# EasyEDA Pro project MiniPID_Manual.epro, board PCB1
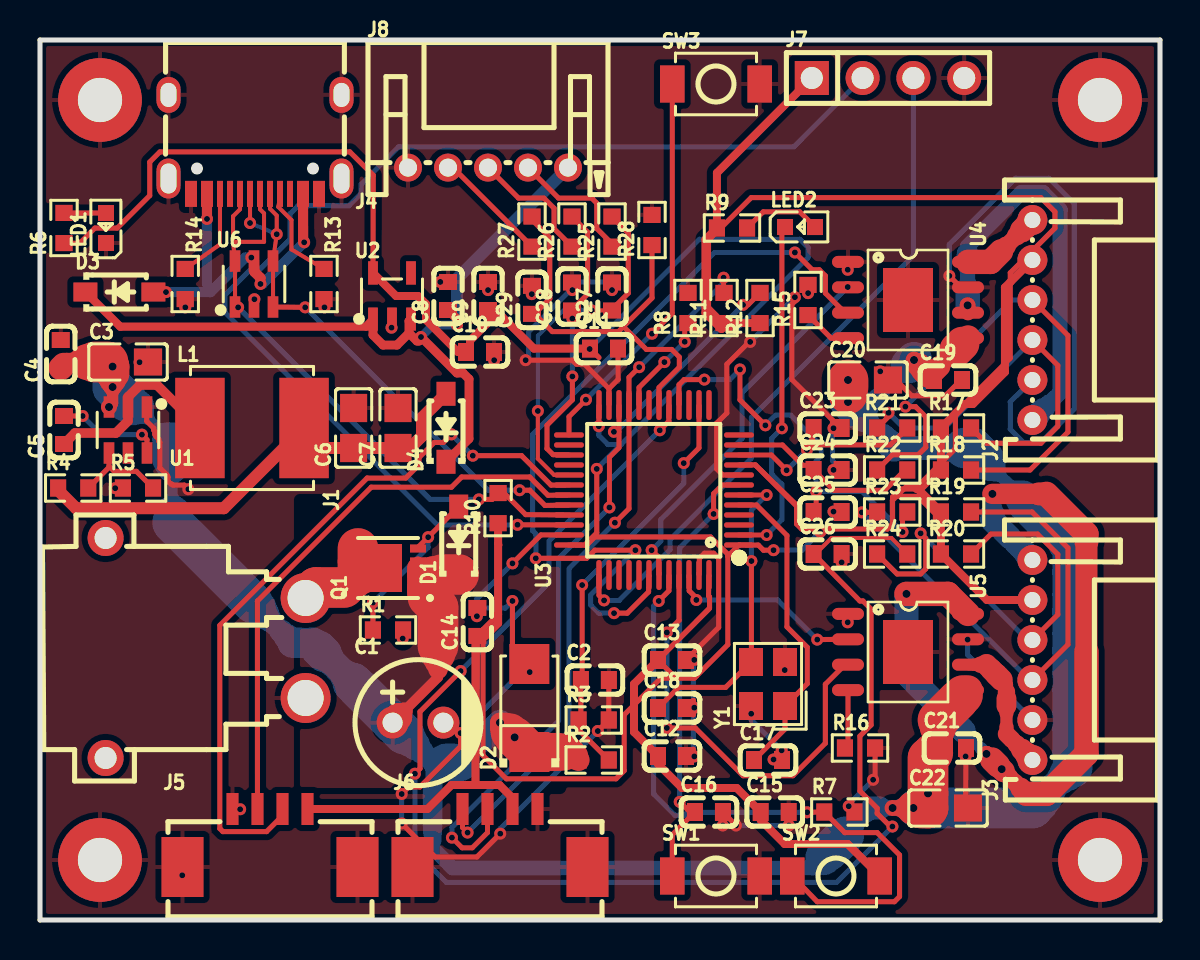
[diagram p1: board, top side]
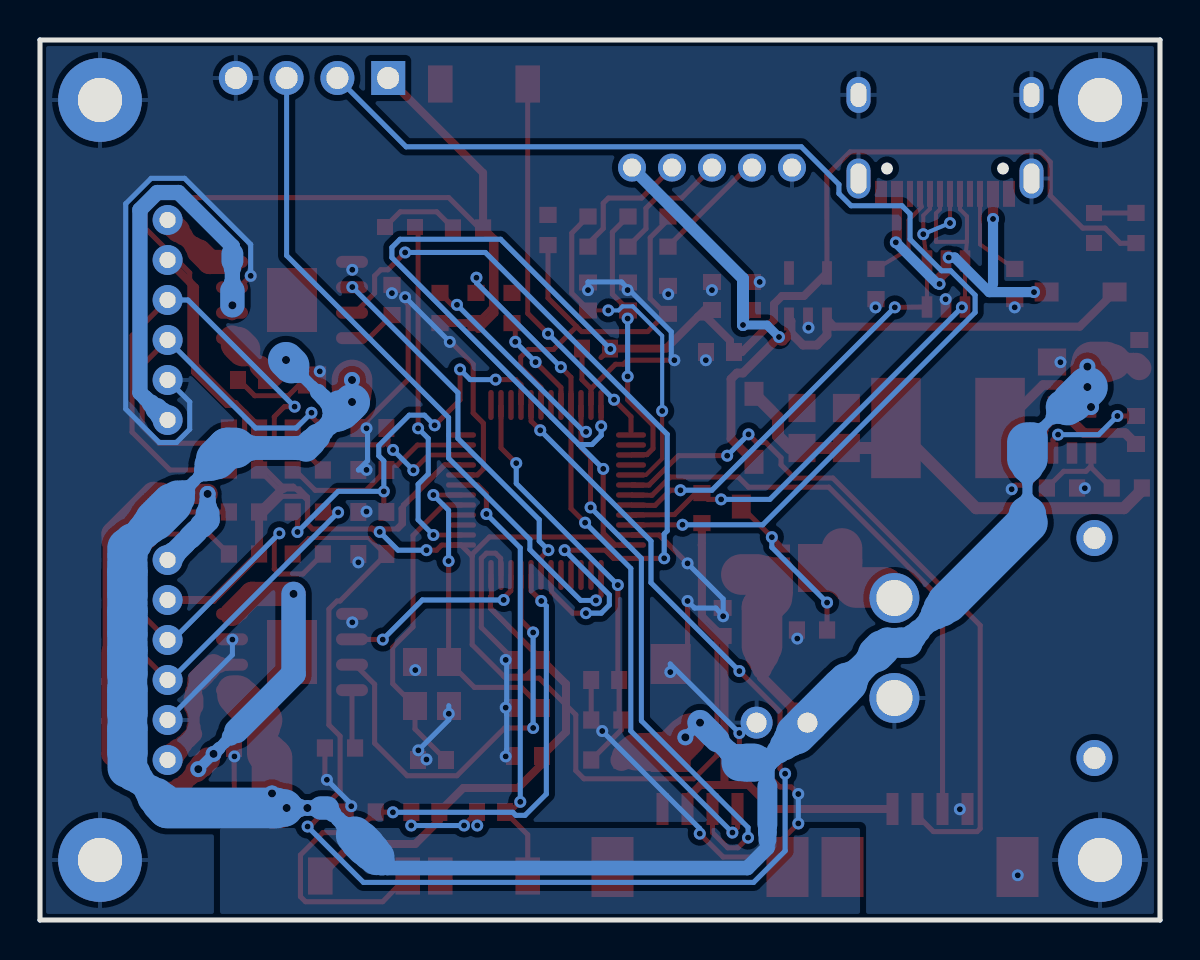
[diagram p2: board, bottom side, seen from below]

Outline 56 x 44 mm; copper layers: Top Layer, Bottom Layer. Coordinates in mm from the lower left corner of the outline.
Outline path: 0,44 56,44 56,0 0,0 0,44
Stack: Top Layer 0.035mm / Dielectric1 1.51mm FR4 er 4.5 / Bottom Layer 0.035mm

## Design rules (mm)
spacing copperThickness1oz (default): track to track 0.2, other pairs 0.15 to 0.3
spacing copperThickness2oz: track to track 0.203, other pairs 0.152 to 0.3
spacing USB_CL: track to track 0.15, other pairs 0.15 to 0.3
track width copperThickness1oz (default): min 0.203, default 0.254, max 2.54
track width copperThickness2oz: min 0.203, default 0.254, max 2.54
track width PWR_HI: min 0.5, default 1, max 5
track width PWR_5V: min 0.3, default 0.6, max 5
track width PWR_3V3: min 0.254, default 0.4, max 5
track width GND_TRK: min 0.254, default 0.5, max 5
differential pair differentialPair (default): width min 0.127, default 0.254, max 2.54; gap min 0.152, default 0.152
net VIN uses PWR_HI, PWR_VIA
net GND uses GND_TRK
net +5V_BUCK uses PWR_5V
net +5V uses PWR_5V
net +3V3 uses PWR_3V3
net VBUS uses PWR_5V, USB_CL
net VIN_RAW uses PWR_HI, PWR_VIA
net M1_OUT1 uses PWR_HI, PWR_VIA
net M1_OUT2 uses PWR_HI, PWR_VIA
net M2_OUT1 uses PWR_HI, PWR_VIA
net M2_OUT2 uses PWR_HI, PWR_VIA
net USB_CC1 uses USB_CL
net USB_DM uses USB_CL
net USB_DP uses USB_CL
net USB_CC2 uses USB_CL
net BUCK_SW uses PWR_5V

## Placement (name value [footprint] x y rotation side)
C1  100uF  [CAP-TH_BD6.3-P2.50-D1.0-FD]  18.9 9.87 0 top
C2  100nF  [C0603]  27.74 12 0 top
C3  10uF  [C0805]  4.4 27.9 0 top
C4  100nF  [C0603]  1.04 28.3 90 top
C5  100nF  [C0603]  1.2 24.5 90 top
C6  22uF  [C0805]  15.68 24.6 90 top
C7  22uF  [C0805]  17.9 24.6 90 top
C8  1uF  [C0603]  20.4 31.2 90 top
C9  4.7uF  [C0603]  22.4 31.2 90 top
C10  100nF  [C0603]  22 28.4 0 top
C11  100nF  [C0603]  28.2 28.57 0 top
C12  100nF  [C0603]  31.6 8.2 0 top
C13  4.7uF  [C0603]  31.6 13 0 top
C14  100nF  [C0603]  21.87 14.9 90 top
C15  1uF  [C0603]  36.74 5.4 0 top
C16  100nF  [C0603]  33.45 5.4 0 top
C17  20pF  [C0603]  36.4 8 0 top
C18  20pF  [C0603]  31.6 10.6 0 top
C19  100nF  [C0603]  45.4 27 0 top
C20  10uF  [C0805]  41.4 27 0 top
C21  100nF  [C0603]  45.6 8.6 0 top
C22  10uF  [C0805]  45.4 5.6 0 top
C23  1nF  [C0603]  39.38 24.6 0 top
C24  1nF  [C0603]  39.38 22.5 0 top
C25  1nF  [C0603]  39.38 20.4 0 top
C26  1nF  [C0603]  39.38 18.3 0 top
C27  1nF  [C0603]  28.6 31.18 90 top
C28  1nF  [C0603]  26.6 31.18 90 top
C29  1nF  [C0603]  24.6 31.01 90 top
D1  BZT52C10  [SOD-123_L2.7-W1.6-LS3.7-RD-1]  20.94 18.97 90 top
D2  SMAJ18A  [SMA_L4.3-W2.6-LS5.2-RD]  24.47 10.6 90 top
D3  B5819W SL  [SOD-123_L2.7-W1.6-LS3.7-RD-1]  3.97 31.4 0 top
D4  B5819W SL  [SOD-123_L2.7-W1.6-LS3.7-RD-1]  20.3 24.61 90 top
J1  XT30PW-M30.G.B  [CONN-TH_XT30PW-M]  8.28 13.6 270 top
J2  S6B-PH-K-S(LF)(SN)  [CONN-TH_6P-P2.00_S6B-PH-K-S-LF-SN]  49.62 30 90 top
J3  S6B-PH-K-S(LF)(SN)  [CONN-TH_6P-P2.00_S6B-PH-K-S-LF-SN]  49.62 13 90 top
J4  TYPE-C-31-M-12  [USB-C_SMD-TYPE-C-31-M-12_1]  10.75 38.78 180 top
J5  A1251WR-S-4P-LCP  [CONN-SMD_A1251WR-S-4P]  11.5 4.1 0 top
J6  A1251WR-S-4P-LCP  [CONN-SMD_A1251WR-S-4P]  23 4.1 0 top
J7  B-2100S04P-A110  [HDR-TH_4P-P2.54-V-M]  42.4 42.1 0 top
J8  S5B-PH-K-S(LF)(SN)  [CONN-TH_S5B-PH-K-S-LF-SN]  22.4 37.62 0 top
L1  10uH  [IND-SMD_L6.0-W6.0_SWPA6045S]  10.6 24.6 0 top
LED1  KT-0603G  [LED0603-RD]  3.3 34.6 90 top
LED2  KT-0603B  [LED0603-RD]  38 34.65 0 top
NOREF  -  [Pad_e949]  3 41 0 top
NOREF#2  -  [Pad_e947]  3 3 0 top
NOREF#3  -  [Pad_e950]  53 41 0 top
NOREF#4  -  [Pad_e948]  53 3 0 top
Q1  AONR21357  [DFN-8_L3.0-W3.0-P0.65-BL]  17.4 17.6 90 top
R1  10kΩ  [R0603]  17.4 14.5 0 top
R2  100kΩ  [R0603]  27.69 8 0 top
R3  10kΩ  [R0603]  27.69 10 0 top
R4  100kΩ  [R0603]  1.66 21.6 0 top
R5  13.3kΩ  [R0603]  4.9 21.6 0 top
R6  1kΩ  [R0603]  1.2 34.6 90 top
R7  10kΩ  [R0603]  39.97 5.4 0 top
R8  10kΩ  [R0603]  32.4 30.6 90 top
R9  1kΩ  [R0603]  34.6 34.6 0 top
R10  1.5kΩ  [R0603]  22.91 20.59 90 top
R11  4.7kΩ  [R0603]  34.2 30.6 90 top
R12  4.7kΩ  [R0603]  36 30.6 90 top
R13  5.1kΩ  [R0603]  14.2 31.8 270 top
R14  5.1kΩ  [R0603]  7.26 31.8 270 top
R15  22kΩ  [R0603]  38.4 31 90 top
R16  22kΩ  [R0603]  41 8.6 0 top
R17  10kΩ  [R0603]  45.8 24.6 0 top
R18  10kΩ  [R0603]  45.8 22.5 0 top
R19  10kΩ  [R0603]  45.8 20.4 0 top
R20  10kΩ  [R0603]  45.8 18.3 0 top
R21  100Ω  [R0603]  42.61 24.6 0 top
R22  100Ω  [R0603]  42.61 22.5 0 top
R23  100Ω  [R0603]  42.61 20.4 0 top
R24  100Ω  [R0603]  42.61 18.3 0 top
R25  1kΩ  [R0603]  28.6 34.42 90 top
R26  1kΩ  [R0603]  26.6 34.42 90 top
R27  5.1kΩ  [R0603]  24.6 34.42 90 top
R28  10kΩ  [R0603]  30.6 34.5 90 top
SW1  TS-1088-AR02016  [SW-SMD_L3.9-W3.0-P4.45]  33.8 2.2 0 top
SW2  TS-1088-AR02016  [SW-SMD_L3.9-W3.0-P4.45]  39.8 2.2 0 top
SW3  TS-1088-AR02016  [SW-SMD_L3.9-W3.0-P4.45]  33.8 41.8 0 top
U1  TPS54202DDCR  [SOT-23-6_L2.9-W1.6-P0.95-LS2.8-BL]  4.4 24.5 180 top
U2  ME6211C33M5G-N  [SOT-23-5_L3.0-W1.7-P0.95-LS2.8-BL]  17.6 31.2 0 top
U3  STM32F103C8T6  [LQFP-48_L7.0-W7.0-P0.50-LS9.0-BL]  30.7 21.5 90 top
U4  DRV8871DDAR  [SO-8_L4.9-W3.9-P1.27-LS6.0-BL-EP]  43.4 31 270 top
U5  DRV8871DDAR  [SO-8_L4.9-W3.9-P1.27-LS6.0-BL-EP]  43.4 13.4 270 top
U6  USBLC6-2SC6  [SOT-23-6_L2.9-W1.6-P0.95-LS2.8-BL]  10.7 31.8 0 top
Y1  16MHz  [CRYSTAL-SMD_4P-L3.2-W2.5-BL]  36.4 11.8 90 top

## Footprints (pads in the part's own frame, mm; a bottom-side part is the same pattern mirrored in y, then rotated)
C0603
  rect 0.8x0.9 smd: 1(-0.7,0) 2(0.7,0)
C0805
  rect 1.41x1.35 smd: 1(-1,0) 2(1,0)
CAP-TH_BD6.3-P2.50-D1.0-FD
  round 1.6 hole 1: 1(-1.27,0) 2(1.27,0)
CONN-SMD_A1251WR-S-4P
  rect 0.6x1.6 smd: 1(1.875,1.45) 2(0.625,1.45) 3(-0.625,1.45) 4(-1.875,1.45)
  rect 2.1x3 smd: 5(-4.375,-1.45) 6(4.375,-1.45)
CONN-TH_6P-P2.00_S6B-PH-K-S-LF-SN
  round 1.5 hole 0.8: 1(-5,0) 2(-3,0) 3(-1,0) 4(1,0) 5(3,0) 6(5,0)
CONN-TH_S5B-PH-K-S-LF-SN
  round 1.4 hole 0.9: 1(4,0) 2(2,0) 3(0,0) 4(-2,0) 5(-4,0)
CONN-TH_XT30PW-M
  round 2.5 hole 1.8: 1(-2.5,5) 2(2.5,5)
  round 1.8 hole 1.1: 3(5.5,-5) 4(-5.5,-5)
CRYSTAL-SMD_4P-L3.2-W2.5-BL
  rect 1.4x1.2 smd: 1(-1.1,-0.85) 2(1.1,-0.85) 3(1.1,0.85) 4(-1.1,0.85)
DFN-8_L3.0-W3.0-P0.65-BL
  rect 0.4x0.8 smd: 1(-0.975,-1.5) 2(-0.325,-1.5) 3(0.325,-1.5) 4(0.975,-1.5) 5(0.975,1.5) 6(0.325,1.5) 7(-0.325,1.5) 8(-0.975,1.5)
  rect 2.4x2.1 smd: 9(0,0.35)
HDR-TH_4P-P2.54-V-M
  rect 1.7x1.7 hole 1.1: 1(-3.81,0)
  round 1.7 hole 1.1: 2(-1.27,0) 3(1.27,0) 4(3.81,0)
IND-SMD_L6.0-W6.0_SWPA6045S
  rect 2.474x5.02 smd: 1(-2.603,0) 2(2.603,0)
LED0603-RD
  rect 0.8x0.8 smd: 1(-0.749,0) 2(0.749,0)
LQFP-48_L7.0-W7.0-P0.50-LS9.0-BL
  oval 0.27x1.5 smd: 1(-2.75,-4.25) 2(-2.25,-4.25) 3(-1.75,-4.25) 4(-1.25,-4.25) 5(-0.75,-4.25) 6(-0.25,-4.25) 7(0.25,-4.25) 8(0.75,-4.25) 9(1.25,-4.25) 10(1.75,-4.25) 11(2.25,-4.25) 12(2.75,-4.25) 25(2.75,4.25) 26(2.25,4.25) 27(1.75,4.25) 28(1.25,4.25) 29(0.75,4.25) 30(0.25,4.25) 31(-0.25,4.25) 32(-0.75,4.25) 33(-1.25,4.25) 34(-1.75,4.25) 35(-2.25,4.25) 36(-2.75,4.25)
  oval 1.5x0.27 smd: 13(4.25,-2.75) 14(4.25,-2.25) 15(4.25,-1.75) 16(4.25,-1.25) 17(4.25,-0.75) 18(4.25,-0.25) 19(4.25,0.25) 20(4.25,0.75) 21(4.25,1.25) 22(4.25,1.75) 23(4.25,2.25) 24(4.25,2.75) 37(-4.25,2.75) 38(-4.25,2.25) 39(-4.25,1.75) 40(-4.25,1.25) 41(-4.25,0.75) 42(-4.25,0.25) 43(-4.25,-0.25) 44(-4.25,-0.75) 45(-4.25,-1.25) 46(-4.25,-1.75) 47(-4.25,-2.25) 48(-4.25,-2.75)
Pad_e947
  rrect 4.191x4.191 hole 2.21: H(0,0)
Pad_e948
  rrect 4.191x4.191 hole 2.21: H(0,0)
Pad_e949
  rrect 4.191x4.191 hole 2.21: H(0,0)
Pad_e950
  rrect 4.191x4.191 hole 2.21: H(0,0)
R0603
  rect 0.806x0.864 smd: 1(-0.753,0) 2(0.753,0)
SMA_L4.3-W2.6-LS5.2-RD
  rect 2x2 smd: 1(-2.2,0) 2(2.2,0)
SO-8_L4.9-W3.9-P1.27-LS6.0-BL-EP
  oval 0.6x1.6 smd: 1(-1.905,-3) 2(-0.635,-3) 3(0.635,-3) 4(1.905,-3) 5(1.905,3) 6(0.635,3) 7(-0.635,3) 8(-1.905,3)
  rect 3.2x2.5 smd: 9(0,0)
SOD-123_L2.7-W1.6-LS3.7-RD-1
  rect 1.2x0.95 smd: 1(-1.7,0) 2(1.7,0)
SOT-23-5_L3.0-W1.7-P0.95-LS2.8-BL
  rect 0.49x1.157 smd: 1(-0.95,-1.153) 2(0,-1.153) 3(0.95,-1.153)
  rect 0.49x1.175 smd: 4(0.95,1.153) 5(-0.95,1.153)
SOT-23-6_L2.9-W1.6-P0.95-LS2.8-BL
  rect 0.532x1.072 smd: 1(-0.95,-1.149) 2(0,-1.149) 3(0.95,-1.149) 4(0.95,1.149) 5(0,1.149) 6(-0.95,1.149)
SW-SMD_L3.9-W3.0-P4.45
  rect 1.23x1.86 smd: 1(-2.185,0) 2(2.185,0)
USB-C_SMD-TYPE-C-31-M-12_1
  oval 1.2x2 hole 0.8x1.5: 1(4.325,1.706) 4(-4.325,1.706)
  oval 1.2x1.8 hole 0.8x1.2: 2(4.325,-2.474) 3(-4.325,-2.474)
  custom 0.6x1.3 smd: A1B12(-3.2,2.474) A4B9(-2.4,2.474) B1A12(3.2,2.474) B4A9(2.401,2.474)
  rect 0.3x1.3 smd: A5(-1.25,2.474) A6(-0.25,2.474) A7(0.25,2.474) A8(1.25,2.474) B5(1.75,2.474) B6(0.75,2.474) B7(-0.75,2.474) B8(-1.75,2.474)

## Nets
As in the schematic, except:
GND: C1.2 C2.2 C3.2 C4.2 C6.2 C7.2 C8.2 C9.2 C10.2 C11.2 C12.2 C13.2 C14.2 C15.2 C16.2 C17.2 C18.2 C19.2 C20.2 C21.2 C22.2 C23.2 C24.2 C25.2 C26.2 C27.2 C28.2 C29.2 D2.2 J1.2 J2.2 J3.2 J4.1 J4.2 J4.3 J4.4 J4.A1B12 J4.B1A12 J5.4 J5.5 J5.6 J6.1 J6.5 J6.6 J7.4 J8.5 LED1.1 NOREF.H NOREF#2.H NOREF#3.H NOREF#4.H R1.2 R3.2 R5.1 R7.2 R8.2 R13.2 R14.2 R15.2 R16.2 R28.2 SW1.2 SW3.2 U1.1 U2.2 U3.8 U3.23 U3.35 U3.47 U4.1 U4.7 U4.9 U5.1 U5.7 U5.9 U6.2 Y1.2 Y1.4

Pads without a net: J1 3 4; J4 A8 B8; U1 5; U2 4; U3 3 4 12 13 15 19 26 28 38 39 40 41

## Via types
v1: diameter 0.802, hole 0.402, Top Layer to Bottom Layer, 7 vias
v2: diameter 0.797, hole 0.402, Top Layer to Bottom Layer, 9 vias
v3: diameter 0.6, hole 0.299, Top Layer to Bottom Layer, 128 vias

## Routing (per net, layer and track width the routed paths; a pad name or vN(x,y) marks a point on that pad's centre or on a via; arc(x,y) is an arc through that point)
+3V3: length 291.3
  Top Layer w0.254: C13.1 33.48,15.6 33.48,16.15 33.43,16.2 33.45,17.25 ; C13.1 31.7,12.19 32.82,12.19 ; C13.1 33.45,15.55 ; v3(36.68,18.49) 36.17,18.49 35.92,18.75 U3.1 34.39,18.19 ; 34.39,18.19 34.39,18.29 33.53,19.15 27.74,19.15 27.33,18.75 27.23,18.75 ; 34.39,18.19 34.39,13.77 32.82,12.19 ; 32.82,12.19 32.72,12.09 31.04,12.09 29.21,10.26 29.21,7.47 28.8,7.06 23.32,7.06 22.15,8.23 ; v3(27.84,22.56) 27.84,19.36 27.23,18.75 ; R6.1 1.98,33.83 2.74,34.59 3.86,34.59 5.49,36.22 5.49,37.9 5.99,38.41 15.49,38.41 16.66,37.24 16.65,32.42 U2.5 ; 43.19,21.55 43.33,21.69 43.89,21.69 45.05,22.85 45.77,23.57 45.77,25.35 48.25,27.83 48.51,28.09 48.51,32.36 50.75,34.59 50.75,35.41 50.04,36.12 35.56,36.12 33.43,33.98 33.43,30.63 34.2,29.85 ; 43.19,21.55 42.82,21.18 ; 43.19,21.55 43.03,21.55 42.63,21.15 42.63,20.99 ; 43.19,21.55 43.83,21.55 ; 27.23,18.75 26.45,18.75 ; 35.8,22.72 37.83,20.69 ; 35.8,22.72 35.76,22.76 34.95,22.75 ; 35.8,22.72 37.83,20.75 37.83,20.69 ; 37.83,20.69 37.83,19.8 38.08,19.55 39.36,19.55 ; 37.83,20.69 37.95,20.57 37.95,19.81 38.15,19.61 ; 42.82,21.18 42.63,20.99 ; 42.82,21.18 43.89,21.18 45.06,20.02 45.05,18.3 ; 21.87,14.2 21.84,8.53 22.15,8.23 ; 22.91,18.84 22.91,19.84 ; 22.91,18.84 22.91,15.29 22.15,14.53 22.15,8.23 ; 22.91,18.84 22.99,18.75 ; 39.36,19.55 39.42,19.61 ; 39.36,19.55 39.22,19.41 v3(39.01,19.41) ; 39.36,19.55 42.37,19.55 42.63,19.8 ; 42.62,20.98 42.63,20.99 ; 42.62,20.98 42.63,19.86 ; 42.62,20.98 42.62,19.86 ; 42.63,20.99 42.63,19.86 ; U3.24 v3(27.94,24.69) ; 42.63,19.86 42.63,19.8 ; 42.63,19.8 42.65,19.83 ; 27.95,28.12 C11.1 v3(27.48,28.55) ; R18.1 44.1,21.55 43.9,21.55
  Top Layer w0.4: C9.1 22.77,30.5 23.1,30.17 ; SW2.2 40.38,3.8 37.24,3.8 36.04,5 C15.1 34.84,6.6 32.1,6.6 30.9,7.8 C12.1 29.7,9.4 29.7,11.8 C13.1 ; 21.78,6.75 22.97,6.75 23.62,6.1 J6.2 ; 21.78,6.75 21.78,14.11 C14.1 22.27,14.2 22.91,14.84 22.91,19.84 ; 21.78,6.75 20.57,6.75 19.38,5.55 J5.1 ; C11.1 24.7,28.57 23.1,30.17 ; R18.1 R17.1 45.77,25.32 46.25,25.8 46.65,25.8 48.25,27.4 48.25,31.63 J2.5 ; 23.1,30.17 22.7,30.17 21.5,28.97 21.5,28.6 C10.1 20.9,28.4 19.3,30 19.3,30.8 18.9,31.2 17.8,31.2 U2.5 16.65,32.74 ; 43.83,21.55 43.9,21.55 R19.1 R20.1 47.35,16 J3.5 ; J7.1 33.85,37.36 R9.1 33.27,34.03 33.27,30.35 34.07,29.55 34.07,29.72 R11.1 R12.1
  Bottom Layer w0.254: v3(27.94,24.69) 27.94,24.23 28.4,23.77 29.06,23.77 ; v3(39.01,19.41) 38.1,18.49 v3(36.68,18.49) ; v3(27.48,28.55) 32.97,34.04 38,34.04 38.41,33.63 38.41,33.12 29.06,23.77 ; 29.06,23.77 v3(27.84,22.56)
+5V: length 41
  Top Layer w0.406: 2.27,31.4 4.01,29.67 16.31,29.67 U2.1
  Top Layer w0.441: 18.45,29.35 18.85,28.95 18.95,28.95 19.05,29.05 v3(19.05,29.15) 20.85,27.35 21.15,27.35 21.45,27.05 21.45,24.06 D4.1 ; 18.45,29.35 17.85,28.75 17.15,28.75 16.65,29.25 U2.1 ; 18.45,29.35 18.45,29.95 U2.3 ; C8.1 20.85,30.05 v3(20.85,29.75)
  Bottom Layer w0.441: v3(20.85,29.75) 19.65,29.75 v3(19.05,29.15)
  Bottom Layer w0.6: v3(20.85,29.75) 20.85,32.07 J8.1
+5V_BUCK: length 23.6
  Top Layer w0.6: R4.1 0.91,21.49 1.8,20.59 9.19,20.59 L1.2 14.2,23.6 C6.1 C7.1 18.5,23.6 19.1,24.2 19.1,25.11 D4.2
GND: length 166.9
  Top Layer w0.254: 28.45,26.57 U3.23 ; 28.45,26.57 28.91,27.03 C11.2 ; 28.45,26.57 27.23,27.79 26.82,27.79 26.62,27.99 v3(24.28,27.99) ; v3(46.38,14.02) U5.7 ; 21.87,15.6 22.2,15.6 v3(21.84,15.19) 21.84,15.55 ; 21.87,15.6 21.84,15.6 21.84,15.55 ; 21.87,15.6 21.84,15.55 ; v3(21.03,9.35) 21.03,8.69 19,6.66 18.44,6.66 v3(18.09,6.3) ; v3(24.59,31.29) 24.59,31.65 C29.2 ; C28.2 26.62,31.85 v3(26.62,31.5) ; v3(18.14,14.07) 18.14,14.43 R1.2 ; v3(23.62,17.83) 25.04,19.25 26.45,19.25 ; J5.4 9.65,5.54 v3(10.01,5.54) ; U2.2 17.58,29.97 v3(17.58,29.62) ; 40.03,22.5 40.08,22.5 40.08,22.5 40.03,22.5 ; 40.03,22.5 v3(39.68,22.5) ; 32.3,10.6 32.36,10.62 v3(32.72,10.62) ; 32.3,10.6 32.66,10.97 v3(32.72,10.62) ; 32.3,10.6 32.66,10.26 v3(32.72,10.62) ; D2.2 24.49,12.8 24.49,12.75 ; D2.2 24.49,12.75 ; D2.2 23.62,13.67 v3(23.62,15.95) ; v3(40.39,32.51) 40.39,32.87 40.4,32.91 ; 24.49,12.75 v3(24.49,12.39) ; C9.2 22.4,31.85 v3(22.4,31.5) ; U3.8 34.14,22.25 33.83,22.56 33.83,24.84 34.34,25.35 34.34,27.79 35.46,28.91 v3(35.51,28.91) ; v3(42.01,27.43) 42.37,27.08 C20.2 42.77,27.03 43.59,26.21 45.26,26.21 46.08,27.03 C19.2 ; C22.2 46.28,5.69 C21.2 46.28,8.53 v3(46.28,8.18) ; v3(37.08,8.48) C17.2 37.03,8.03 v3(36.68,8.03) ; v3(7.26,30.63) 7.26,30.99 7.26,31.05 ; v3(20.01,31.9) 20.37,31.9 20.4,31.9 ; v3(38.41,31.34) 38.41,31.7 38.4,31.75 ; C3.2 5.33,27.89 v3(4.98,27.89) ; R13.2 14.22,30.99 v3(14.22,30.63) ; 32.3,13 32.36,12.95 32.66,12.95 v3(32.72,13) 32.36,13 32.3,13 ; 32.3,13 33.93,14.63 33.93,18.08 33.68,18.34 33.22,18.34 32.97,18.08 32.95,17.25 ; 40.4,15.31 40.39,15.24 v3(40.39,14.88) ; 37.25,12.9 37.24,12.85 v3(37.24,12.5) ; 40.59,5.54 40.59,5.94 v3(40.44,5.69) 40.59,5.54 ; 40.59,5.54 40.69,5.44 40.72,5.4 40.59,5.54 ; 28.6,31.9 v3(28.6,31.5) ; 35.56,10.67 35.56,10.72 Y1.4 35.56,10.67 ; 35.56,10.67 v3(35.56,10.31) ; 4.15,21.6 4.11,21.59 v3(3.76,21.59) ; v3(39.68,20.42) 40.03,20.42 40.08,20.4 ; v3(45.47,32.21) 46.03,31.65 U4.7 ; v3(18.09,4.83) 19.76,3.15 21.84,3.15 v3(23.01,4.32) ; v3(22.71,27.99) 22.71,28.35 C10.2 ; v3(37.74,31.14) 37.74,30.94 37.59,30.78 37.59,27.03 39.62,24.99 39.62,24.44 v3(39.68,24.59) 40.03,24.59 40.08,24.6 ; 7.12,2.65 7.11,2.59 v3(7.11,2.23) ; C2.2 28.44,10 v3(27.89,9.45) ; v3(34.8,4.72) C16.2 34.14,5.33 v3(34.14,4.72) ; v3(10.72,31.04) 10.72,30.68 10.7,30.65 ; 41.75,8.6 41.76,7.11 v3(41.66,7.01) ; 40.08,18.3 v3(40.08,17.88) ; 5.35,25.65 5.33,25.6 5.33,24.94 5.69,24.59 5.69,24.49 5.74,24.44 5.74,24.28 5.79,24.23 5.79,24.18 5.94,24.03 5.94,23.93 5.99,23.88 5.99,22.61 6.35,22.25 6.35,22.2 6.4,22.15 6.4,21.95 6.55,21.79 6.6,21.79 6.66,21.74 7.21,21.74 v3(7.42,21.54) ; 37.34,5.28 37.34,4.72 v3(37.44,4.72) 37.44,5.33 37.43,5.4 37.34,5.28 ; 32.66,8.53 v3(32.72,8.18) 32.36,8.18 32.3,8.2 32.66,8.53
  Bottom Layer w0.254: v3(37.08,8.48) 35.56,10.01 v3(35.56,10.31) 35.56,10.72 ; v3(39.68,24.59) 39.62,24.44 39.62,22.96 40.08,22.5 v3(39.68,22.5) ; v3(37.44,4.72) v3(34.8,4.72) ; J3.2 46.38,13.26 v3(46.38,14.02) ; v3(23.62,17.83) 21.84,16.05 v3(21.84,15.19) 22.2,15.6 23.27,15.6 v3(23.62,15.95) ; v3(21.03,9.35) 24.49,12.8 v3(24.49,12.39) ; v3(32.72,8.18) 32.66,8.53 32.66,10.26 v3(32.72,10.62) 32.66,10.97 32.66,12.95 v3(32.72,13) ; v3(40.44,5.69) 40.59,5.94 v3(41.66,7.01) ; v3(18.09,4.83) v3(18.09,6.3) ; v3(24.28,27.99) 24.44,28.14 24.44,29.41 26.92,31.9 28.6,31.9 v3(28.6,31.5) ; v3(23.01,4.32) 23.01,4.57 v3(27.89,9.45) ; v3(35.51,28.91) v3(37.74,31.14) ; J2.2 48.51,25.91 48.51,24.54 49.17,23.88 50.04,23.88 51.71,25.55 51.71,35.81 50.44,37.08 48.77,37.08 45.47,33.78 v3(45.47,32.21)
VBUS: length 16.5
  Top Layer w0.508: 13.15,36.31 13.16,33.93 v3(13.21,33.88) ; 8.35,35.66 v3(8.35,35.05) ; v3(10.57,33.12) U6.5 10.72,32.41 11.02,32.11 v3(11.02,31.8) ; D3.2 v3(6.3,31.39)
  Bottom Layer w0.508: v3(10.57,33.12) 10.26,33.12 8.53,31.39 v3(6.3,31.39) ; v3(8.35,35.05) 8.35,31.8 ; v3(11.02,31.8) 11.12,31.8 v3(13.21,33.88)
VIN: length 139.2
  Top Layer w0.5: 18.2,10.44 19.9,12.14 19.9,12.53 ; 18.9,17.6 Q1.3
  Top Layer w0.559: v1(3.45,25.65) 3.63,25.83 3.63,26.38
  Top Layer w0.61: v2(3.63,26.65) 3.63,26.38
  Top Layer w0.726: v2(42.63,5.6) 42.98,5.6
  Top Layer w0.787: 44.7,27.39 C19.1 44.45,27.25
  Top Layer w0.813: 44.98,27.68 45.55,28.25
  Top Layer w0.838: v2(43.7,28) 43.95,27.75
  Top Layer w0.864: 42.98,5.6 43.34,5.6
  Top Layer w0.889: 18.2,10.44 17.91,10.15
  Top Layer w0.914: 1.19,27.75 1.34,27.9 1.68,27.9 ; v2(3.63,26.65) 3.63,26.99
  Top Layer w0.965: 2.03,27.9 1.68,27.9 ; 19.9,12.91 19.9,12.53
  Top Layer w1: v2(23,9.87) 23.24,9.62
  Top Layer w1.067: 44.7,27.39 44.98,27.68
  Top Layer w1.092: 18.9,17.28 19.31,17.28 ; 18.9,17.28 Q1.1 19.15,16.38 ; 18.9,17.28 18.9,17.6 ; 26.73,8.2 R2.1
  Top Layer w1.117: 45.55,28.25 45.83,28.53
  Top Layer w1.194: 43.95,27.75 44.2,27.5
  Top Layer w1.219: v2(40.4,25.9) 40.4,26.27 ; 43.34,5.6 v1(43.67,5.6) ; 1.19,27.75 C4.1
  Top Layer w1.27: 46.12,28.81 U4.5
  Top Layer w1.296: 44.2,27.5 44.45,27.25 ; 2.37,27.9 2.03,27.9
  Top Layer w1.321: 3.63,26.99 3.63,27.33 ; 19.9,13.3 19.9,12.91
  Top Layer w1.346: 26.53,8.4 26.73,8.2
  Top Layer w1.397: 17.91,10.15 C1.1
  Top Layer w1.423: 26.19,8.4 26.53,8.4
  Top Layer w1.473: 46.15,11.25 U5.5
  Top Layer w1.498: 44.65,8.35 C21.1 44.9,9.3 ; 23.24,9.62 23.49,9.38
  Top Layer w1.55: 44.9,9.3 44.9,9.65
  Top Layer w1.6: 19.15,16.38 19.4,16.12
  Top Layer w1.677: 3.63,27.33 v1(3.63,27.67) C3.1
  Top Layer w1.702: 45.83,28.53 46.12,28.81 ; 19.31,17.28 19.71,17.28
  Top Layer w1.727: 43.69,5.6 44.05,5.6 ; 19.9,13.69 19.9,13.3
  Top Layer w1.804: 2.71,27.9 2.37,27.9
  Top Layer w1.829: 44.9,9.65 44.9,10
  Top Layer w1.854: 25.84,8.4 26.19,8.4 ; 19.71,17.28 20.12,17.28
  Top Layer w1.905: 24.22,8.64 D2.1 25.84,8.4 ; 23.49,9.38 v1(23.73,9.13)
  Top Layer w1.931: 40.4,26.27 40.4,26.63
  Top Layer w1.981: 45.9,11 46.15,11.25
  Top Layer w2.006: 44.4,8.1 44.65,8.35
  Top Layer w2.032: 44.4,8.1 v1(44.4,6.33) C22.1 44.05,5.6 ; C3.1 2.71,27.9 ; 44.9,10 45.9,11 ; 19.4,16.12 19.9,15.62 19.9,13.69 ; 40.4,26.63 v1(40.4,27) ; v1(23.73,9.13) 24.22,8.64 ; 20.12,17.28 20.93,17.28
  Bottom Layer w0.5: 6.63,21.07 6.63,21.87 ; 5.87,24.63 5.36,25.14
  Bottom Layer w0.508: v1(3.45,25.65) v2(3.63,26.65) v1(3.63,27.67) ; v2(23,9.87) v1(23.73,9.13) ; v2(40.4,25.9) v1(40.4,27) ; v2(42.63,5.6) v1(44.4,6.33)
  Bottom Layer w0.554: 42.37,26.67 42.9,27.2
  Bottom Layer w0.559: 48.3,21.93 48.02,22.21 ; 6.63,21.87 6.63,22.27 ; 6.12,24.38 5.87,24.63
  Bottom Layer w0.584: 48.57,21.66 48.3,21.93 ; 42.1,26.4 42.37,26.67
  Bottom Layer w0.66: 48.02,22.21 47.74,22.49
  Bottom Layer w0.686: 6.63,20.67 6.63,21.07
  Bottom Layer w0.711: 42.9,27.2 43.17,27.47 ; 48.85,21.38 48.57,21.66
  Bottom Layer w0.726: 19.63,3.99 19.63,3.6 20.63,2.6 38.63,2.6 38.9,2.87 ; 19.63,7.87 19.63,6.7 ; 41.08,5.05 41.36,5.33
  Bottom Layer w0.737: 43.02,5.6 v2(42.63,5.6) 42.3,5.6 ; 5.36,25.14 5.1,25.39
  Bottom Layer w0.762: 40.81,4.78 41.08,5.05
  Bottom Layer w0.813: 41.83,26.13 42.1,26.4
  Bottom Layer w0.838: 41.57,25.87 41.83,26.13 ; 41.96,5.6 42.3,5.6
  Bottom Layer w0.864: 41.36,5.33 41.63,5.6 ; 40.54,4.51 40.81,4.78
  Bottom Layer w0.889: 19.63,4.38 19.63,3.99
  Bottom Layer w0.914: 41.3,25.6 41.57,25.87 ; 43.02,5.6 43.41,5.6 ; 6.38,24.12 6.12,24.38
  Bottom Layer w0.94: 41.85,24.45 41.57,24.73 ; 19.63,4.76 19.63,4.38
  Bottom Layer w0.991: 19.63,6.7 19.63,4.76 ; 6.63,22.27 6.63,22.67
  Bottom Layer w1: 19.97,7.87 19.63,7.87 19.34,8.15 ; 21.57,8.44 22.14,9.01
  Bottom Layer w1.016: 19.06,8.44 19.34,8.15
  Bottom Layer w1.042: 21.28,8.15 21.57,8.44 ; 12.06,14.44 11.77,14.73 ; 41.57,24.73 41.29,25.01
  Bottom Layer w1.067: 11.77,14.73 11.49,15.01 ; 42.13,24.17 41.85,24.45
  Bottom Layer w1.117: 47.74,22.49 47.46,22.77
  Bottom Layer w1.169: 41.63,5.6 41.96,5.6 ; 5.1,25.39 4.85,25.65 ; 12.34,14.15 12.06,14.44
  Bottom Layer w1.194: 45.45,23.6 43.09,23.6
  Bottom Layer w1.219: 6.63,20.27 6.63,20.67 ; 43.09,23.6 42.7,23.6 ; 41,25.6 41.3,25.6 ; 11.49,15.01 11.2,15.3 ; 18.77,8.73 19.06,8.44 ; 49.13,21.1 48.85,21.38
  Bottom Layer w1.244: 43.17,27.47 43.43,27.73 ; 40.27,4.24 40.54,4.51 ; 22.14,9.01 22.43,9.3
  Bottom Layer w1.27: 45.84,23.6 45.45,23.6 ; 22.43,9.3 v2(23,9.87) ; 41.29,25.01 41.09,25.21
  Bottom Layer w1.296: 21,7.87 21.28,8.15 ; 12.63,13.87 12.34,14.15 ; 43.41,5.6 43.8,5.6 ; 38.9,2.87 39.18,3.15 ; 42.42,23.88 42.13,24.17
  Bottom Layer w1.371: 42.7,23.6 42.42,23.88 ; 50.49,6.46 51.06,7.03
  Bottom Layer w1.397: 15.06,12.44 14.49,13.01
  Bottom Layer w1.423: 15.34,12.15 15.06,12.44
  Bottom Layer w1.473: 13.63,13.87 12.96,13.87 ; 18.49,9.01 18.77,8.73
  Bottom Layer w1.498: 51.06,7.03 51.34,7.31 ; 14.49,13.01 14.2,13.3
  Bottom Layer w1.524: 13.92,13.58 13.63,13.87 ; 11.2,15.3 10.92,15.58 ; 12.96,13.87 12.63,13.87 ; 6.63,23.87 6.38,24.12
  Bottom Layer w1.55: 46.24,23.6 45.84,23.6
  Bottom Layer w1.575: 50.2,6.17 50.49,6.46 ; 41.09,25.21 40.9,25.4
  Bottom Layer w1.6: 6.63,22.67 6.63,23.07 ; 19.97,7.87 20.31,7.87
  Bottom Layer w1.625: 47.46,22.77 47.19,23.04 ; 15.63,11.87 15.34,12.15
  Bottom Layer w1.651: 51.07,19.16 50.8,19.43
  Bottom Layer w1.677: 51.35,18.88 51.07,19.16
  Bottom Layer w1.702: 18.2,9.3 18.49,9.01
  Bottom Layer w1.727: 4.85,25.65 4.63,25.65
  Bottom Layer w1.752: 50.8,19.43 50.52,19.71 ; 49.41,20.82 49.13,21.1 ; 51.34,7.31 51.63,7.6
  Bottom Layer w1.778: 40.7,25.6 40.55,25.75 ; 40.7,25.6 41,25.6 ; 40.7,25.6 40.9,25.4
  Bottom Layer w1.804: 39.18,3.15 39.45,3.42 ; 14.2,13.3 13.92,13.58 ; 43.43,27.73 v2(43.7,28) ; 40.55,25.75 v2(40.4,25.9)
  Bottom Layer w1.829: 4.63,25.65 4.38,25.9 ; 10.92,15.58 10.63,15.87
  Bottom Layer w1.854: 20.66,7.87 21,7.87 ; 50.52,19.71 50.24,19.99
  Bottom Layer w1.879: 49.92,5.89 50.2,6.17 ; 43.8,5.6 44.19,5.6 ; 6.63,19.87 6.63,20.27 ; 39.99,3.96 40.27,4.24
  Bottom Layer w1.905: 20.31,7.87 20.66,7.87 ; 39.45,3.42 39.72,3.69
  Bottom Layer w1.931: 51.63,18.6 51.35,18.88
  Bottom Layer w1.981: 51.63,17.81 51.63,18.21 ; 51.63,13.89 51.63,14.28 ; 51.63,11.53 51.63,12.31 ; 51.63,15.85 51.63,16.24 ; 39.72,3.69 39.99,3.96 ; 51.63,7.6 51.63,8.39 ; 51.63,9.56 51.63,10.35
  Bottom Layer w2.006: 51.63,17.42 51.63,17.81 ; 51.63,13.49 51.63,13.89 ; 51.63,15.46 51.63,15.85 ; 49.63,5.6 49.92,5.89 ; 15.92,11.58 15.63,11.87 ; 51.63,18.21 51.63,18.6
  Bottom Layer w2.032: 15.92,11.58 C1.1 18.2,9.3 ; 47.19,23.04 46.63,23.6 46.24,23.6 ; 51.63,8.39 51.63,9.56 ; 51.63,12.31 51.63,13.49 ; 44.19,5.6 49.63,5.6 ; 51.63,14.28 51.63,15.46 ; 10.63,15.87 6.63,19.87 ; 51.63,10.35 51.63,11.53 ; 6.63,23.07 6.63,23.87 ; 4.38,25.9 v2(3.63,26.65) ; 50.24,19.99 49.41,20.82 ; 51.63,16.24 51.63,17.42
VIN_RAW: length 6.1
  Top Layer w1.016: 15.9,16.95 Q1.8 15.55,16.62
  Top Layer w1.55: 15.9,16.95 15.9,17.28 ; 15.55,16.62 15.2,16.62
  Top Layer w1.702: 16.89,17.44 16.72,17.28 16.45,17.28
  Top Layer w1.727: 16.18,17.28 16.45,17.28
  Top Layer w1.879: 15.9,17.28 16.18,17.28
  Top Layer w2.032: 15.9,17.28 Q1.6 15.9,18.58 ; 15.2,16.62 13.81,16.62 J1.1 ; 16.89,17.44 Q1.9
VIN_SENSE: length 20.9
  Top Layer w0.249: U3.14 32.95,23.61 v3(32.19,22.84) ; C2.1 27.11,12.06 v3(27.11,16.75)
  Top Layer w0.254: C2.1 27.04,10.11 R3.1 26.93,9.51 R2.2
  Bottom Layer w0.249: v3(27.11,16.75) 32.19,21.83 v3(32.19,22.84)
BOOT0: length 33.1
  Top Layer w0.254: v3(30.94,15.95) 31.44,16.46 31.45,17.25 ; v3(38.35,5.39) 39.21,5.4 40.23,4.37 41.86,4.37 42.98,3.25 42.98,1.17 42.72,0.91 38.86,0.91 SW2.1
  Bottom Layer w0.254: v3(38.35,5.39) 32.36,5.39 32.21,5.23 31.75,5.23 30.68,6.3 30.68,15.7 v3(30.94,15.95)
BOOT1: length 5.1
  Top Layer w0.249: v3(32.24,28.91) 32.24,29.68 R8.1 ; U3.20 29.95,26.62 v3(31.22,27.89)
  Bottom Layer w0.249: v3(31.22,27.89) v3(32.24,28.91)
BUCK_FB: length 4.8
  Top Layer w0.254: 3.45,22.69 3.7,22.43 4.82,22.43 R5.2 ; R4.2 3.45,22.64 U1.4
BUCK_SW: length 10.1
  Top Layer w0.479: 4.4,26.15 5,26.75 5.85,26.75 L1.1 ; 4.4,26.15 4.4,24.95 3.8,24.35 1.75,24.35 C5.1 ; 4.4,26.15 U1.2
CTL_IN1: length 17.8
  Top Layer w0.203: v3(24.89,25.45) 24.89,23.06 25.71,22.25 26.45,22.25 ; C27.1 v3(27.58,30.48)
  Top Layer w0.254: C27.1 28.6,30.53 29.41,31.34 29.41,34.34 R25.2
  Bottom Layer w0.203: v3(24.89,25.45) 24.89,29.21 26.37,30.68 26.87,30.68 27.08,30.48 v3(27.58,30.48)
CTL_IN2: length 14
  Top Layer w0.254: R26.2 27.38,34.39 27.38,31.29 26.62,30.53 C28.1 v3(26.62,30.07) ; v3(26.62,27.18) 26.62,26.01 25.35,24.74 25.35,23.57 25.65,23.27 26.45,23.25
  Bottom Layer w0.254: v3(26.62,30.07) v3(26.62,27.18)
CTL_IN3: length 21.5
  Top Layer w0.249: U3.18 30.95,26.62 31.97,27.64 31.97,28.15 31.59,28.53 30.31,28.53 29.17,29.67 28.92,29.42 25.62,29.42 24.73,30.31 C29.1
  Top Layer w0.254: 24.73,30.31 25.49,31.07 25.49,34.12 24.6,35.01 R27.2 ; 29.17,29.67 30.6,31.1 R28.1
ENC1_A: length 10.6
  Top Layer w0.249: v3(38.35,23.5) 38.6,23.76 38.6,24.52 C23.1 ; U3.10 36.57,23.25 v3(37.33,22.49)
  Top Layer w0.254: 38.6,24.01 38.86,23.76 42.52,23.76 43.36,24.6
  Bottom Layer w0.249: v3(37.33,22.49) v3(38.35,23.5)
ENC1_A_RAW: length 20.2
  Top Layer w0.254: R17.2 47.32,23.84 50.05,23.84 50.89,24.68 50.89,27.73 J2.3 ; v3(42.43,25.36) 42.43,25.17 R21.1
  Bottom Layer w0.254: J2.3 45.22,24.6 43.19,24.6 v3(42.43,25.36)
ENC1_B: length 9.8
  Top Layer w0.249: C24.1 38.45,22.73 38.14,22.73 37.12,23.75 U3.11
  Top Layer w0.254: C24.1 39.7,21.48 42.24,21.48 43.25,22.5 43.36,22.5
ENC1_B_RAW: length 27.2
  Top Layer w0.254: J2.4 51.4,29.22 51.4,24.4 49.5,22.5 R18.2 ; R22.1 42.62,23.26 43.91,23.26 44.29,23.63 44.29,25.16 43.78,25.67 v3(43.27,25.67)
  Bottom Layer w0.254: J2.4 48.6,31 v3(43.27,25.67)
ENC2_A: length 21.1
  Top Layer w0.249: v3(35,27.53) 35,26 v3(36.27,24.73) ; v3(33.22,27.02) 32.2,27.02 31.95,26.77 U3.16 ; v3(38.81,21.43) 38.81,20.53 C25.1
  Top Layer w0.254: 43.36,20.4 43.13,20.16 v3(43.13,19.4)
  Bottom Layer w0.249: v3(35,27.53) 34.49,27.02 v3(33.22,27.02) ; v3(38.81,21.43) 38.81,22.96 39.06,23.21 39.06,23.72 37.54,25.24 36.78,25.24 v3(36.27,24.73)
  Bottom Layer w0.254: v3(38.81,21.43) 41.09,21.43 v3(43.13,19.4)
ENC2_A_RAW: length 25.7
  Top Layer w0.254: J3.3 51.4,13.78 51.4,18.6 49.6,20.4 R19.2 ; v3(41.09,20.38) 41.84,20.38 R23.1
  Bottom Layer w0.254: J3.3 49.48,12 v3(41.09,20.38)
ENC2_B: length 74.5
  Top Layer w0.203: C26.1 38.76,18.29 39.57,19.1 42.57,19.1 R24.2
  Top Layer w0.254: v3(21.03,12.45) 19,10.41 19,7.57 v3(18.75,7.31) ; v3(30.99,24.49) 31.44,24.94 U3.17 ; v3(42.62,4.67) 42.52,4.67 41.86,5.33 41.86,5.59 41,6.45 41,9.19 41.55,9.75 41.55,15.55 41.15,15.95 41,15.95 C26.1
  Bottom Layer w0.254: v3(30.99,24.49) 25.45,18.95 25.45,16.87 v3(21.03,12.45) ; v3(18.75,7.31) 18.75,3.45 20.32,1.88 39.83,1.88 v3(42.62,4.67)
ENC2_B_RAW: length 22.6
  Top Layer w0.254: R24.1 42.85,17.3 44.03,17.3 44.29,17.56 44.29,19.08 v3(44.03,19.33) ; R20.2 47.55,19.3 49.87,19.3 50.89,18.28 50.89,15.27 J3.4
  Bottom Layer w0.254: J3.4 49.37,14 v3(44.03,19.33)
I2C_SCL: length 35.1
  Top Layer w0.249: J6.4 21.12,4.63 v3(21.38,4.37) ; v3(28.75,19.87) 29.45,20.57 U3.21 29.45,27.13 v3(29.96,27.64) ; v3(34.18,32.11) 34.18,31.37 34.2,31.35
  Bottom Layer w0.249: v3(21.38,4.37) 26.46,9.45 26.46,17.58 v3(28.75,19.87) ; v3(29.96,27.64) 34.18,31.86 v3(34.18,32.11)
I2C_SDA: length 39
  Top Layer w0.249: 28.95,24.41 v3(28.7,24.41) ; v3(35.15,30.76) 35.41,30.76 36,31.35 ; v3(28.47,20.63) 28.47,23.14 28.95,23.61 U3.22 ; v3(20.6,4.12) 21.1,3.61 21.61,3.61 22.38,4.37 J6.3
  Bottom Layer w0.249: v3(28.47,20.63) 25.93,18.09 25.93,9.96 20.6,4.63 v3(20.6,4.12) ; v3(35.15,30.76) 28.8,24.41 v3(28.7,24.41)
LED_STAT: length 17.6
  Top Layer w0.249: v3(37.09,24.58) 37.09,34.49 LED2.1 ; U3.2 v3(36.33,19.25)
  Bottom Layer w0.249: v3(37.09,24.58) 36.59,24.08 36.59,22.3 37.09,21.79 37.09,20.01 v3(36.33,19.25)
M1_IN1: length 40.7
  Top Layer w0.254: v3(37.74,33.38) 38.61,32.51 38.96,32.51 39.27,32.21 39.27,31.34 40.23,30.38 40.4,30.37 ; v3(29.77,18.49) 27.74,18.49 27.33,18.08 v3(24.79,18.08) ; v3(28.7,15.34) 29.36,15.34 30.43,16.41 30.45,17.25
  Bottom Layer w0.254: v3(37.74,33.38) 33.73,33.38 24.64,24.28 24.64,19.46 24.79,19.3 v3(24.79,18.08) ; v3(28.7,15.34) 27.94,15.34 27.53,15.75 27.53,16.26 v3(29.77,18.49)
M1_IN2: length 18.6
  Top Layer w0.254: 30.95,17.25 30.94,18.14 v3(30.58,18.49) ; v3(40.39,31.65) U4.2
  Bottom Layer w0.254: v3(40.39,31.65) 35.1,26.36 35.1,24.08 31.04,20.02 31.04,18.95 v3(30.58,18.49)
M1_OUT1: length 20.5
  Top Layer w0.762: 46.4,30.37 v2(46.38,30.73)
  Bottom Layer w0.762: 50.73,26.09 51,26.36 51,35.51 50.14,36.37 49.07,36.37 46.38,33.68 46.38,33.31 ; 46.38,31.84 46.38,32.58
  Bottom Layer w0.787: 50.73,26.09 50.45,25.82
  Bottom Layer w0.864: 46.38,31.47 46.38,31.84 ; 46.38,32.58 46.38,32.94
  Bottom Layer w0.914: 50.45,25.82 50.17,25.55
  Bottom Layer w1.092: 46.38,32.94 46.38,33.31
  Bottom Layer w1.117: 50.17,25.55 49.9,25.27
  Bottom Layer w1.219: v2(46.38,30.73) 46.38,31.47 ; 49.9,25.27 J2.1
M1_OUT2: length 4.1
  Top Layer w0.813: 48.31,33.69 48.83,34.21
  Top Layer w0.965: 48.05,33.43 48.31,33.69 ; 48.83,34.21 49.1,34.48
  Top Layer w1.194: 49.1,34.48 49.36,34.74
  Top Layer w1.219: U4.8 47.53,32.91 48.05,33.43 ; 49.36,34.74 J2.6
M2_IN1: length 22
  Top Layer w0.254: v3(31.34,9.6) 32.77,9.6 35.15,7.21 37.64,7.21 39.27,8.84 39.27,11.79 40.23,12.75 40.4,12.77 ; v3(31.34,14.38) 31.95,14.99 31.95,17.25
  Bottom Layer w0.254: v3(31.34,14.38) v3(31.34,9.6)
M2_IN2: length 9.8
  Top Layer w0.254: v3(32.82,16) 32.82,16.1 32.46,16.46 32.45,17.25 ; U5.2 v3(38.86,14.02)
  Bottom Layer w0.254: v3(38.86,14.02) 36.88,16 v3(32.82,16)
M2_OUT1: length 6.6
  Top Layer w0.554: U5.6 46.71,12.77
  Top Layer w0.61: 48.32,10.36 48.32,9.65 ; 46.71,12.77 47.02,12.77
  Top Layer w0.66: 48.32,11.41 48.32,11.77 48.07,12.02
  Top Layer w0.711: 48.32,10.71 48.32,10.36 ; 48.32,9.65 48.32,9.3
  Top Layer w0.813: 47.02,12.77 47.32,12.77
  Top Layer w0.838: 48.58,9.04 48.84,8.78
  Top Layer w0.864: 48.32,11.41 48.32,11.06 ; 48.32,9.3 48.58,9.04
  Top Layer w0.914: 48.84,8.78 49.1,8.52
  Top Layer w0.991: 48.32,11.06 48.32,10.71
  Top Layer w1.067: 47.32,12.77 47.57,12.52
  Top Layer w1.092: 49.1,8.52 49.36,8.26 ; 47.57,12.52 47.82,12.27
  Top Layer w1.117: 47.82,12.27 48.07,12.02
  Top Layer w1.219: 49.36,8.26 J3.1
M2_OUT2: length 41.5
  Top Layer w0.787: v2(47.32,8.31) 47.61,8.02
  Top Layer w0.813: 48.47,7.16 48.75,6.88
  Top Layer w0.864: 48.75,6.88 49.04,6.59 ; 48.18,7.45 48.47,7.16
  Top Layer w1.016: 49.94,21.31 v2(47.62,21.31)
  Top Layer w1.042: 49.04,6.59 49.32,6.31
  Top Layer w1.092: 52.32,13.41 52.32,18.91
  Top Layer w1.117: 47.89,7.73 48.18,7.45
  Top Layer w1.143: 50.32,21.31 49.94,21.31
  Top Layer w1.194: 52.32,18.91 52.32,19.31
  Top Layer w1.219: U5.8 45.4,16.31 v2(43.32,16.31) ; 47.61,8.02 47.89,7.73 ; 52.32,13.41 52.32,8.31 50.32,6.31 49.32,6.31 ; 52.32,19.31 50.32,21.31
  Bottom Layer w0.508: v2(47.32,8.31) v1(48.09,7.54)
  Bottom Layer w0.559: 46.75,8.88 47.04,8.59
  Bottom Layer w0.584: 46.47,9.16 46.75,8.88
  Bottom Layer w0.635: 47.04,8.59 v2(47.32,8.31)
  Bottom Layer w0.787: v2(47.62,21.31) 47.62,20.98
  Bottom Layer w0.813: 47.62,20.98 47.62,20.65
  Bottom Layer w0.889: 46.18,9.45 46.47,9.16
  Bottom Layer w0.94: 47.62,20.65 47.62,20.33
  Bottom Layer w1.092: 48.48,19.14 48.76,18.86 ; 47.91,19.71 48.19,19.43
  Bottom Layer w1.117: 48.76,18.86 49.33,18.29
  Bottom Layer w1.169: 48.19,19.43 48.48,19.14
  Bottom Layer w1.194: 47.62,20.33 47.62,20
  Bottom Layer w1.219: 47.62,20 47.91,19.71 ; v2(43.32,16.31) 43.32,12.31 46.18,9.45 ; 49.33,18.29 J3.6
NRST: length 22.2
  Top Layer w0.249: C16.1 32.49,5.4 v3(31.99,5.91) ; v3(33.68,20.3) 33.68,21.32 34.11,21.75 U3.7
  Top Layer w0.254: SW1.1 31.62,4.27 C16.1
  Bottom Layer w0.249: v3(33.68,20.3) 31.99,18.61 v3(31.99,5.91)
OSC_IN: length 15.8
  Top Layer w0.249: U3.5 35.82,20.75 37.35,19.23 37.35,14.65 38.36,13.64 38.36,11.81 Y1.1
  Top Layer w0.254: C17.1 37.25,9.55 Y1.1
OSC_OUT: length 15.7
  Top Layer w0.249: U3.6 v3(36.33,21.25) ; v3(35.57,17.95) 35.57,12.92 Y1.3
  Top Layer w0.254: Y1.3 34.28,11.63 31.93,11.63 C18.1
  Bottom Layer w0.249: v3(35.57,17.95) 35.57,20.49 v3(36.33,21.25)
SWCLK: length 34.3
  Top Layer w0.249: U3.37 27.95,16.23 v3(28.2,15.98)
  Bottom Layer w0.249: v3(28.2,15.98) 28.97,15.98 31.51,18.52 31.51,19.03 35.57,23.09 35.57,25.12 43.67,33.22 J7.3
SWDIO: length 59.9
  Top Layer w0.254: v3(23.88,19.76) 26.45,19.75
  Bottom Layer w0.254: v3(23.88,19.76) 19.86,19.76 9.25,30.38 9.25,31.24 10.47,32.46 10.92,32.46 12.5,34.04 12.5,35.31 12.9,35.71 15.44,35.71 16.05,36.32 16.05,36.78 17.93,38.66 37.69,38.66 J7.2
UART_RX: length 28.9
  Top Layer w0.254: 10.87,5.55 10.87,15.95 16.56,21.64 20.57,21.64 21.08,22.15 24.49,22.15 25.4,21.23 26.45,21.25
UART_TX: length 36.7
  Top Layer w0.254: v3(21.64,23.22) 24.08,23.22 25.55,21.74 26.45,21.75 ; v3(20.57,24.28) 20.17,23.88 19.71,23.88 18.95,23.11 18.95,22.76 18.29,22.1 16.36,22.1 8.99,14.73 8.99,4.57 9.14,4.42 11.33,4.42 12.14,5.23 12.13,5.55
  Bottom Layer w0.254: v3(21.64,23.22) v3(20.57,24.28)
USB_CC1: length 4.7
  Top Layer w0.203: 12,36.07 11.91,35.66 12.57,35 12.57,33.53 14.2,32.55
USB_CC2: length 4
  Top Layer w0.203: 9,35.66 9,33.78 7.26,32.55
USB_DM: length 26.3
  Top Layer w0.203: 11.5,35.66 11.5,35.56 11.84,35.22 v3(11.84,34.29) 11.65,32.95 11.65,30.65 ; 10.5,35.66 v3(10.5,34.85)
  Top Layer w0.254: v3(23.98,21.49) 24.49,21.49 25.25,20.73 26.45,20.75 ; 11.65,30.65 v3(13.26,30.63)
  Bottom Layer w0.203: v3(10.5,34.85) v3(11.84,34.29)
  Bottom Layer w0.254: v3(13.26,30.63) 22.4,21.49 v3(23.98,21.49)
USB_DP: length 29.8
  Top Layer w0.203: 9.75,30.65 9.75,32.95 9.65,33.91 ; 9.65,33.91 9.65,35.19 10,35.53 10,35.66 ; 9.65,33.91 11.2,33.91 11.2,35.33 11,35.53 11,35.66
  Top Layer w0.254: 9.75,30.65 v3(9.91,30.63) ; v3(21.95,21.03) 22.61,21.03 22.91,21.35 23.22,21.34 24.28,20.27 26.45,20.25
  Bottom Layer w0.254: v3(21.95,21.03) 19.51,21.03 v3(9.91,30.63)
USER_BTN: length 19.7
  Top Layer w0.249: v3(27.3,26.01) 26.45,25.17 U3.25 ; SW3.1 31.62,30.33 v3(30.6,29.32)
  Bottom Layer w0.249: v3(30.6,29.32) v3(27.3,26.01)
$1N288: length 8.7
  Top Layer w0.254: D1.2 v3(19.41,19.14) 18.9,18.63 18.9,18.58 ; v3(16.65,15.87) R1.1
  Bottom Layer w0.254: v3(16.65,15.87) 19.41,18.63 v3(19.41,19.14)
$1N314: length 2.1
  Top Layer w0.254: LED1.2 1.2,35.35
$1N369: length 4
  Top Layer w0.254: 35.35,34.6 36.16,35.41 37.99,35.41 LED2.2
$1N378: length 2.5
  Top Layer w0.254: U4.4 39.55,29.09 R15.1
$1N402: length 3
  Top Layer w0.254: R16.1 40.4,8.75 U5.4
$1N482: length 5.8
  Top Layer w0.254: J8.4 20.65,37.62 R27.1
$1N485: length 6.4
  Top Layer w0.254: J8.3 23.92,36.1 25.19,36.1 25.7,35.59 25.7,34.57 R26.1
$1N488: length 6.7
  Top Layer w0.254: J8.2 25.92,36.1 27.58,36.1 27.84,35.84 27.84,34.57 28.6,33.81 R25.1
$1N529: length 5.3
  Top Layer w0.254: v3(5.1,24.27) 5.35,24.01 U1.6 ; v3(2.13,25.2) C5.2
  Bottom Layer w0.254: v3(5.1,24.27) 3.06,24.27 v3(2.13,25.2)

## Copper pours and planes (outline as drawn; the poured copper is in the pictures)
GND on Top Layer: 0,0 0,44 56,44 56,0
GND on Bottom Layer: 0,0 0,44 56,44 56,0
VIN on Top Layer: 13,6.6 13,21 26,21 26,6.6
VIN on Bottom Layer: 15,0.3 15,4.6 47,4.6 47,0.3
